# Altium schematic sheet MOSFET-Motor-Sheet-2.SchDoc
size 420 x 297 mm; SheetNumber: 8; SheetTotal: 15
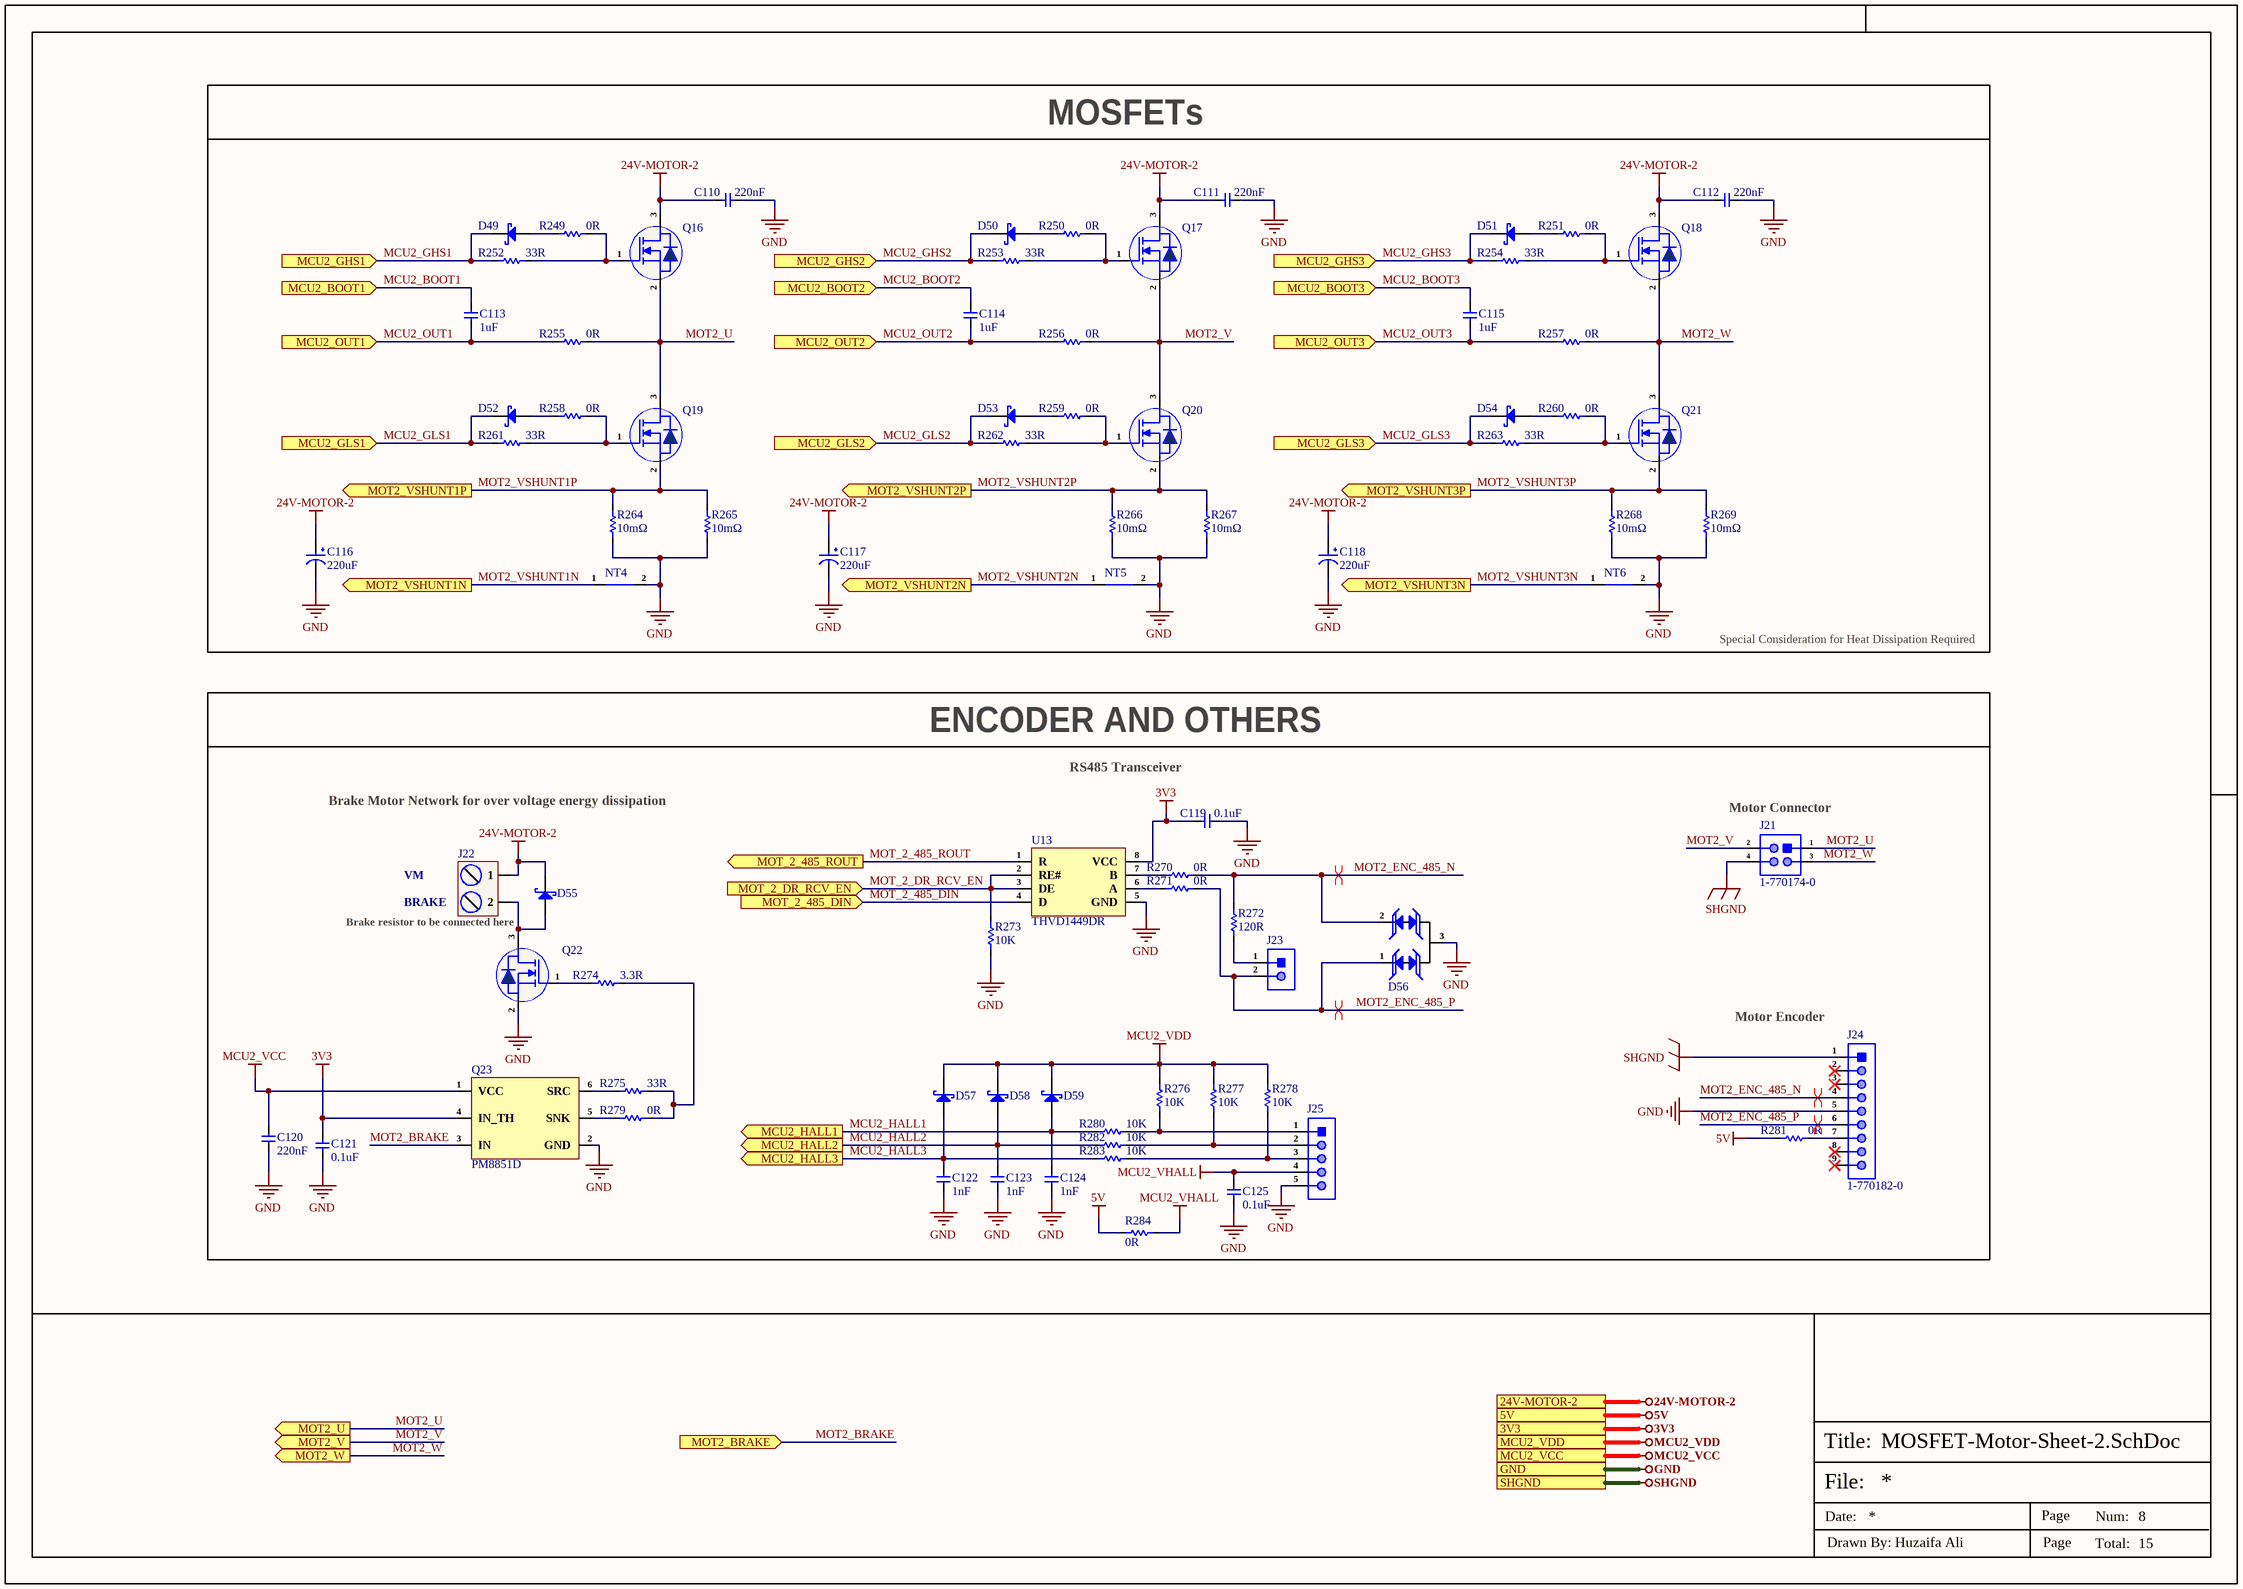
[diagram p0: MOSFET-Motor-Sheet-2.SchDoc]

## Parts
C110  220nF  [Cap-0805]
C111  220nF  [Cap-0805]
C112  220nF  [Cap-0805]
C113  1uF  [Cap-0603]
C114  1uF  [Cap-0603]
C115  1uF  [Cap-0603]
C116  220uF  [SPE1VM221E12OL]
C117  220uF  [SPE1VM221E12OL]
C118  220uF  [SPE1VM221E12OL]
C119  0.1uF  [Cap-0402]
C120  220nF  [Cap-0402]
C121  0.1uF  [Cap-0402]
C122  1nF  [Cap-0402]
C123  1nF  [Cap-0402]
C124  1nF  [Cap-0402]
C125  0.1uF  [Cap-0402]
D49  BAT48JFILM  [SOD-323]  (value not drawn)
D50  BAT48JFILM  [SOD-323]  (value not drawn)
D51  BAT48JFILM  [SOD-323]  (value not drawn)
D52  BAT48JFILM  [SOD-323]  (value not drawn)
D53  BAT48JFILM  [SOD-323]  (value not drawn)
D54  BAT48JFILM  [SOD-323]  (value not drawn)
D55  STPS3H100UF  [SMB_]  (value not drawn)
D56  SM712  [SOT-23]  (value not drawn)
D57  BAT30KFILM  [SOD-523]  (value not drawn)
D58  BAT30KFILM  [SOD-523]  (value not drawn)
D59  BAT30KFILM  [SOD-523]  (value not drawn)
J21  1-770174-0  [1-770174-0]
J22  DB128L-5.08-2P-BK-S  [DB128L-5.08-2P-BK-S]  (value not drawn)
J23  X6511WV-02H-C60D30  [HDR1X2_]  (value not drawn)
J24  1-770182-0  [1-770182-0]
J25  X6511WV-05H-C60D30  [HDR1X5_]  (value not drawn)
NT4  Net Tie_SMD  [Net Tie Pad]  (value not drawn)  (net tie, no BOM)
NT5  Net Tie_SMD  [Net Tie Pad]  (value not drawn)  (net tie, no BOM)
NT6  Net Tie_SMD  [Net Tie Pad]  (value not drawn)  (net tie, no BOM)
Q16  STH240N10F7-2  [H2PAK-2]  (value not drawn)
Q17  STH240N10F7-2  [H2PAK-2]  (value not drawn)
Q18  STH240N10F7-2  [H2PAK-2]  (value not drawn)
Q19  STH240N10F7-2  [H2PAK-2]  (value not drawn)
Q20  STH240N10F7-2  [H2PAK-2]  (value not drawn)
Q21  STH240N10F7-2  [H2PAK-2]  (value not drawn)
Q22  STH240N10F7-2  [H2PAK-2]  (value not drawn)
Q23  PM8851D  [SOT-23-6]
R249  0R  [Res-0805]
R250  0R  [Res-0805]
R251  0R  [Res-0805]
R252  33R  [Res-0402]
R253  33R  [Res-0402]
R254  33R  [Res-0402]
R255  0R  [Res-0805]
R256  0R  [Res-0805]
R257  0R  [Res-0805]
R258  0R  [Res-0805]
R259  0R  [Res-0805]
R260  0R  [Res-0805]
R261  33R  [Res-0402]
R262  33R  [Res-0402]
R263  33R  [Res-0402]
R264  10mΩ  [RES-2512]
R265  10mΩ  [RES-2512]
R266  10mΩ  [RES-2512]
R267  10mΩ  [RES-2512]
R268  10mΩ  [RES-2512]
R269  10mΩ  [RES-2512]
R270  0R  [Res-0402]
R271  0R  [Res-0402]
R272  120R  [Res-0603]
R273  10K  [Res-0402]
R274  3.3R  [Res-0402]
R275  33R  [Res-0402]
R276  10K  [Res-0402]
R277  10K  [Res-0402]
R278  10K  [Res-0402]
R279  0R  [Res-0805]
R280  10K  [Res-0402]
R281  0R  [Res-0402]
R282  10K  [Res-0402]
R283  10K  [Res-0402]
R284  0R  [Res-0805]
U13  THVD1449DR  [SOIC-8(0.154", 3.90mm Width)]

## Blocks framed on the sheet
MOSFETs: C110-C118 D49-D54 NT4-NT6 Q16-Q21 R249-R269
ENCODER AND OTHERS: C119-C125 D55-D59 J21-J25 Q22 Q23 R270-R284 U13

## Ports
3V3, 5V, 24V-MOTOR-2, GND, MCU2_BOOT1 (in), MCU2_BOOT2 (in), MCU2_BOOT3 (in), MCU2_GHS1 (in), MCU2_GHS2 (in), MCU2_GHS3 (in), MCU2_GLS1 (in), MCU2_GLS2 (in), MCU2_GLS3 (in), MCU2_HALL1 (out), MCU2_HALL2 (out), MCU2_HALL3 (out), MCU2_OUT1 (in), MCU2_OUT2 (in), MCU2_OUT3 (in), MCU2_VCC, MCU2_VDD, MOT2_BRAKE (in), MOT2_U (out), MOT2_V (out), MOT2_VSHUNT1N (out), MOT2_VSHUNT1P (out), MOT2_VSHUNT2N (out), MOT2_VSHUNT2P (out), MOT2_VSHUNT3N (out), MOT2_VSHUNT3P (out), MOT2_W (out), MOT_2_485_DIN (in), MOT_2_485_ROUT (out), MOT_2_DR_RCV_EN (in), SHGND

## Nets
3V3: C119.2 C121.2 Q23.4(IN_TH) U13.8(VCC) ; port 3V3
5V: R281.1 R284.1 ; port 5V
24V-MOTOR-2: C110.2 C111.2 C112.2 C116.1 C117.1 C118.1 D55.2(K) J22.1 Q16.3(D) Q17.3(D) Q18.3(D) ; port 24V-MOTOR-2
GND: C110.1 C111.1 C112.1 C116.2 C117.2 C118.2 C119.1 C120.1 C121.1 C122.1 C123.1 C124.1 C125.2 D56.3(GND) J24.5 J25.5 NT4.2 NT5.2 NT6.2 Q22.2(S) Q23.2(GND) R264.1 R265.1 R266.1 R267.1 R268.1 R269.1 R273.2 U13.5(GND) ; port GND
MCU2_VCC: C120.2 Q23.1(VCC) ; port MCU2_VCC
MCU2_VDD: D57.2(K) D58.2(K) D59.2(K) R276.2 R277.2 R278.2 ; port MCU2_VDD
MCU2_VHALL: C125.1 J25.4 R284.2
SHGND: J21.4 J24.1 ; port SHGND
MCU2_BOOT1: C113.2 ; port MCU2_BOOT1
MCU2_BOOT2: C114.2 ; port MCU2_BOOT2
MCU2_BOOT3: C115.2 ; port MCU2_BOOT3
MCU2_GHS1: D49.1(K) R252.1 ; port MCU2_GHS1
MCU2_GHS2: D50.1(K) R253.1 ; port MCU2_GHS2
MCU2_GHS3: D51.1(K) R254.1 ; port MCU2_GHS3
MCU2_GLS1: D52.1(K) R261.1 ; port MCU2_GLS1
MCU2_GLS2: D53.1(K) R262.1 ; port MCU2_GLS2
MCU2_GLS3: D54.1(K) R263.1 ; port MCU2_GLS3
MCU2_HALL1: C124.2 D59.1(A) R280.1 ; port MCU2_HALL1
MCU2_HALL2: C123.2 D58.1(A) R282.1 ; port MCU2_HALL2
MCU2_HALL3: C122.2 D57.1(A) R283.1 ; port MCU2_HALL3
MCU2_OUT1: C113.1 R255.1 ; port MCU2_OUT1
MCU2_OUT2: C114.1 R256.1 ; port MCU2_OUT2
MCU2_OUT3: C115.1 R257.1 ; port MCU2_OUT3
MOT2_BRAKE: Q23.3(IN) ; port MOT2_BRAKE
MOT2_ENC_485_N: D56.2(I/O2) J24.4 R270.2 R272.2
MOT2_ENC_485_P: D56.1(I/O1) J23.2 J24.6 R271.2
MOT2_U: J21.1 Q16.2(S) Q19.3(D) R255.2 ; port MOT2_U
MOT2_V: J21.2 Q17.2(S) Q20.3(D) R256.2 ; port MOT2_V
MOT2_VSHUNT1N: NT4.1 ; port MOT2_VSHUNT1N
MOT2_VSHUNT1P: Q19.2(S) R264.2 R265.2 ; port MOT2_VSHUNT1P
MOT2_VSHUNT2N: NT5.1 ; port MOT2_VSHUNT2N
MOT2_VSHUNT2P: Q20.2(S) R266.2 R267.2 ; port MOT2_VSHUNT2P
MOT2_VSHUNT3N: NT6.1 ; port MOT2_VSHUNT3N
MOT2_VSHUNT3P: Q21.2(S) R268.2 R269.2 ; port MOT2_VSHUNT3P
MOT2_W: J21.3 Q18.2(S) Q21.3(D) R257.2 ; port MOT2_W
MOT_2_485_DIN: U13.4(D) ; port MOT_2_485_DIN
MOT_2_485_ROUT: U13.1(R) ; port MOT_2_485_ROUT
MOT_2_DR_RCV_EN: R273.1 U13.2(RE#) U13.3(DE) ; port MOT_2_DR_RCV_EN
NetD49_2: D49.2(A) R249.1
NetD50_2: D50.2(A) R250.1
NetD51_2: D51.2(A) R251.1
NetD52_2: D52.2(A) R258.1
NetD53_2: D53.2(A) R259.1
NetD54_2: D54.2(A) R260.1
NetD55_1: D55.1(A) J22.2 Q22.3(D)
NetJ23_1: J23.1 R272.1
NetJ24_7: J24.7 R281.2
NetJ25_1: J25.1 R276.1 R280.2
NetJ25_2: J25.2 R277.1 R282.2
NetJ25_3: J25.3 R278.1 R283.2
NetQ16_1: Q16.1(G) R249.2 R252.2
NetQ17_1: Q17.1(G) R250.2 R253.2
NetQ18_1: Q18.1(G) R251.2 R254.2
NetQ19_1: Q19.1(G) R258.2 R261.2
NetQ20_1: Q20.1(G) R259.2 R262.2
NetQ21_1: Q21.1(G) R260.2 R263.2
NetQ22_1: Q22.1(G) R274.1
NetQ23_5: Q23.5(SNK) R279.1
NetQ23_6: Q23.6(SRC) R275.1
NetR270_1: R270.1 U13.7(B)
NetR271_1: R271.1 U13.6(A)
NetR274_2: R274.2 R275.2 R279.2

Not connected (* = marked no-connect by the designer): J24 2* 3* 8* 9*

## Layout directives
differential pair: MOT2_ENC_485_N, MOT2_ENC_485_P
differential pair; differential pair class DIFF_RS485: MOT2_ENC_485_N, MOT2_ENC_485_P

## Notes on the sheet
- Special Consideration for Heat Dissipation Required
- Brake Motor Network for over voltage energy dissipation
- (near C119) RS485 Transceiver
- (near J21) Motor Connector
- VM
- BRAKE
- Brake resistor to be connected here
- (near J24) Motor Encoder
- File:
- Title:
- Date:
- Page
- Num:
- Total:
- Drawn By: Huzaifa Ali

## Library data of the parts
C110-C112 = CC0805KKX7R0BB224: CAP CER 0.22UF 100V X7R 0805; Manufacturer: Yageo; Item Type: Capacitor; Tolerance: 10%; Supplier: Future Electronics; LCSC Part Number: C513710; Manufacturer Part Number: CC0805KKX7R0BB224; RoHS: Yes; Stock: 123000; Pricing: 3000=0.0385, 9000=0.0376, 15000=0.0372, 60000=0.0361, 90000=0.0353 (USD); Mounting Technology: Surface Mount; Case/Package: 0805; Case Code (Metric): 2012; Case Code (Imperial): 0805; Weight: 0.000194oz; Min Operating Temperature: -55°C; Max Operating Temperature: 125°C; Packaging: Tape and Reel; Value: 220nF; Voltage Rating: 100V; Dielectric: X7R; Termination: SMD/SMT; Voltage Rating (DC): 100V; Package Quantity: 3000; Series: CC; Length: 2mm; Width: 1.25mm; RoHS Compliant: Yes; ComponentLink1URL: https://media.digikey.com/pdf/Data%20Sheets/Yageo%20PDFs/NPO,%20X7R%20Mid-voltage.pdf?src-supplier=Digikey; ComponentLink1Description: https://media.digikey.com/pdf/Data%20Sheets/Yageo%20PDFs/NPO,%20X7R%20Mid-voltage.pdf?src-supplier=Digikey; ComponentLink2URL: http://www.mouser.com/ds/2/447/Yageo_UPY-GP_NP0_16V-to-50V_9-358835.pdf?src-supplier=Mouser; ComponentLink2Description: http://www.mouser.com/ds/2/447/Yageo_UPY-GP_NP0_16V-to-50V_9-358835.pdf?src-supplier=Mouser; ComponentLink3URL: https://datasheet.octopart.com/CC0805KKX7R0BB224-Yageo-datasheet-137700083.pdf?src-supplier=Future+Electronics; ComponentLink3Description: https://datasheet.octopart.com/CC0805KKX7R0BB224-Yageo-datasheet-137700083.pdf?src-supplier=Future+Electronics; ComponentLink4URL: http://www.yageo.com/documents/recent/UPY-NP0X7R_MV_100-to-630V_21.pdf?src-supplier=Digikey; ComponentLink4Description: http://www.yageo.com/documents/recent/UPY-NP0X7R_MV_100-to-630V_21.pdf?src-supplier=Digikey; ComponentLink5URL: https://datasheet.octopart.com/CC0805KKX7R0BB224-Yageo-datasheet-166511530.pdf?src-supplier=Future+Electronics; ComponentLink5Description: https://datasheet.octopart.com/CC0805KKX7R0BB224-Yageo-datasheet-166511530.pdf?src-supplier=Future+Electronics; ComponentLink6URL: https://datasheet.octopart.com/CC0805KKX7R0BB224-Yageo-datasheet-101324229.pdf?src-supplier=Newark; ComponentLink6Description: https://datasheet.octopart.com/CC0805KKX7R0BB224-Yageo-datasheet-101324229.pdf?src-supplier=Newark
C113-C115 = CL10A105KB8NNNC: CAP CER 1UF 50V X5R 0603; Manufacturer: Samsung; Material: 4241ConductorMaterial; Tolerance: 10%; Item Type: Capacitor; Supplier: Avnet; Supplier Part Number: CL10A105KB8NNNC; Manufacturer Part Number: CL10A105KB8NNNC; RoHS: Yes; Category: Ceramic Capacitors; Stock: 780446; Pricing: 4000=0.01632, 8000=0.01595, 16000=0.01557, 24000=0.0152, 32000=0.01482 (USD); Mounting Technology: Surface Mount; Case/Package: 0603; Case Code (Metric): 1608; Case Code (Imperial): 0603; Min Operating Temperature: -55°C; Max Operating Temperature: 85°C; Packaging: Tape and Reel; Value: 1uF; Voltage Rating: 50V; Dielectric: X5R; Series: CL; Voltage Rating (DC): 50V; Length: 1.6mm; Depth: 0.8mm; Radiation Hardening: No; RoHS Compliant: Yes; ComponentLink1URL: https://datasheet.ciiva.com/26877/getdatasheetpartid-753736-26877879.pdf?src-supplier=Verical; ComponentLink1Description: https://datasheet.ciiva.com/26877/getdatasheetpartid-753736-26877879.pdf?src-supplier=Verical; LCSC Part Number: C15849
C116-C118 = SPE1VM221E12OL: 35V 220uF ±20% Plugin,D6.3xL12mm Polymer Aluminum Capacitors ROHS; Manufacturer: Yunxing; Manufacturer Part Number: SPE1VM221E12OL; Package: Plugin,D6.3xL12mm; LCSC Part Number: C698133; Item Type: Capacitor; ComponentLink1Description: LCSC; ComponentLink1URL: https://www.lcsc.com/product-detail/Polymer-Aluminum-Capacitors_Yunxing-SPE1VM221E12OL_C698133.html?s_z=n_SPE1VM221E12OL
C119 C121 C125 = CC0402JRX7R7BB104: CAP CER 0.1UF 16V X7R 0402; Manufacturer: Yageo; Material: 4241ConductorMaterial; Value: 100nF; Tolerance: 5%; Item Type: Capacitor; Supplier: Digikey; Supplier Part Number: 311-1676-1-ND; Manufacturer Part Number: CC0402JRX7R7BB104; RoHS: Yes; Category: Ceramic Capacitors; Stock: 1659111; Pricing: 1=0.1, 10=0.046, 50=0.0262, 100=0.0203, 500=0.01528, 1000=0.012, 2500=0.01091, 5000=0.01004 (USD); Mounting Technology: Surface Mount; Case/Package: 0402; Case Code (Metric): 1005; Case Code (Imperial): 0402; Min Operating Temperature: -55°C; Max Operating Temperature: 125°C; Dielectric: X7R; Packaging: Tape and Reel; Package Quantity: 10000; Voltage Rating (DC): 16V; Voltage Rating: 16V; Series: CC; Construction: Flat; Length: 0.039inch; Width: 0.02inch; Height: 0.5mm; Thickness: 0.022inch; Lead Free: Lead Free; Halogen Free: Halogen Free; RoHS Compliant: Yes; ComponentLink1URL: https://datasheet.ciiva.com/13210/upy-gphc-x7r-6-3v-to-50v-8-12304-13210152.pdf?src-supplier=Mouser; ComponentLink1Description: https://datasheet.ciiva.com/13210/upy-gphc-x7r-6-3v-to-50v-8-12304-13210152.pdf?src-supplier=Mouser; LCSC Part Number: C541464
C120 = CC0402KRX5R8BB224: CAP CER 0.22UF 25V X5R 0402; Manufacturer: Yageo; Item Type: Capacitors; Tolerance: 10%; Supplier 1: Mouser; Manufacturer Part Number: CC0402KRX5R8BB224; RoHS: Yes; Stock 1: 61266; Pricing 1: 1=0.10000, 10=0.03300, 50=0.03300, 100=0.02700, 1000=0.01500, 10000=0.01300 (USD); Mount: Surface Mount; Case/Package: 0402; Min Operating Temperature: -55°C; Max Operating Temperature: 85°C; Packaging: Tape and Reel; Capacitance: 220nF; Voltage Rating: 25V; Voltage Rating (DC): 25V; Dielectric: X5R; Length: 0.039inch; Width: 0.02inch; Thickness: 0.022inch; Lead Free: Lead Free; Halogen Free: Halogen Free; RoHS Compliant: Yes; ComponentLink1URL: http://www.yageo.com/documents/recent/UPY-GPHC_X5R_4V-to-50V_25.pdf?src-supplier=Digi-Key; ComponentLink1Description: http://www.yageo.com/documents/recent/UPY-GPHC_X5R_4V-to-50V_25.pdf?src-supplier=Digi-Key; ComponentLink2URL: https://www.yageo.com/upload/media/product/productsearch/datasheet/mlcc/UPY-GPHC_X5R_4V-to-50V_26.pdf?src-supplier=Digi-Key; ComponentLink2Description: https://www.yageo.com/upload/media/product/productsearch/datasheet/mlcc/UPY-GPHC_X5R_4V-to-50V_26.pdf?src-supplier=Digi-Key; ComponentLink3URL: http://www.yageo.com/documents/recent/UPY-GPHC_X5R_4V-to-50V_23.pdf?src-supplier=Digi-Key; ComponentLink3Description: http://www.yageo.com/documents/recent/UPY-GPHC_X5R_4V-to-50V_23.pdf?src-supplier=Digi-Key; Supplier Part Number 1: 603-CC402KRX5R8BB224; LCSC Part Number: C326836
C122-C124 = CC0402KRX7R8BB102: CAP CER 1000PF 25V X7R 0402; Manufacturer: Yageo; Tolerance: 10%; Dissipation Factor: 2.5%; Insulation Resistance: 10GR; Item Type: Capacitor; Supplier 1: Arrow Electronics; Manufacturer Part Number: CC0402KRX7R8BB102; RoHS: Yes; Category: Ceramic Capacitors; Stock 1: 370000; Pricing 1: 1=0.00230, 10000=0.00230, 100001=0.00190 (USD); Mount: Surface Mount; Case/Package: 0402; Number of Pins: 2; Case Code (Imperial): 0402; Case Code (Metric): 1005; Min Operating Temperature: -55°C; Max Operating Temperature: 125°C; Capacitance: 1nF; Packaging: Tape and Reel; Voltage Rating: 25V; Dielectric: X7R; Termination: SMD/SMT; Voltage Rating (DC): 25V; Series: CC; Length: 1mm; Width: 0.02inch; Thickness: 0.022inch; Depth: 0.5mm; Radiation Hardening: No; Lead Free: Lead Free; Halogen Free: Halogen Free; RoHS Compliant: Yes; ComponentLink1URL: https://datasheet.ciiva.com/26862/getdatasheetpartid-639817-26862638.pdf?src-supplier=Verical; ComponentLink1Description: https://datasheet.ciiva.com/26862/getdatasheetpartid-639817-26862638.pdf?src-supplier=Verical; ComponentLink2URL: https://datasheet.ciiva.com/5425/upy-gp-np0-16v-to-50v-8-3714-5425527.pdf?src-supplier=Mouser; ComponentLink2Description: https://datasheet.ciiva.com/5425/upy-gp-np0-16v-to-50v-8-3714-5425527.pdf?src-supplier=Mouser; Supplier Part Number 1: CC0402KRX7R8BB102; LCSC Part Number: C541372
D49-D54 = BAT48JFILM: DIODE SCHOTTKY 40V 350MA SOD323; Manufacturer: STMicroelectronics; Supplier: Future Electronics; LCSC Part Number: C2798199; Manufacturer Part Number: BAT48JFILM; RoHS: Yes; Item Type: Diode; Stock: 21000; Pricing: 3000=0.0329, 9000=0.0316, 15000=0.031, 30000=0.0303, 60000=0.0291 (USD); ComponentLink1URL: https://datasheet.ciiva.com/23920/1449576-23920129.pdf?src-supplier=Newark; ComponentLink1Description: https://datasheet.ciiva.com/23920/1449576-23920129.pdf?src-supplier=Newark; ComponentLink2URL: https://datasheet.ciiva.com/4714/cd00130229-113731-4714649.pdf?src-supplier=Mouser; ComponentLink2Description: https://datasheet.ciiva.com/4714/cd00130229-113731-4714649.pdf?src-supplier=Mouser; ComponentLink3URL: https://datasheet.ciiva.com/915/cd00130229-915689.pdf?src-supplier=Digikey; ComponentLink3Description: https://datasheet.ciiva.com/915/cd00130229-915689.pdf?src-supplier=Digikey; ComponentLink4URL: https://datasheet.ciiva.com/915/cd00130229-915690.pdf?src-supplier=Digikey; ComponentLink4Description: https://datasheet.ciiva.com/915/cd00130229-915690.pdf?src-supplier=Digikey; ComponentLink5URL: https://datasheet.ciiva.com/915/cd00130229-915691.pdf?src-supplier=Digikey; ComponentLink5Description: https://datasheet.ciiva.com/915/cd00130229-915691.pdf?src-supplier=Digikey; ComponentLink6URL: https://datasheet.ciiva.com/16206/cd00130229-16206668.pdf?src-supplier=Future+Electronics; ComponentLink6Description: https://datasheet.ciiva.com/16206/cd00130229-16206668.pdf?src-supplier=Future+Electronics
D55 = STPS3H100UF: DIODE SCHOTTKY 100V 3A SMBFLAT; Manufacturer: STMicroelectronics; Supplier: Mouser; LCSC Part Number: C155643; Manufacturer Part Number: STPS3H100UF; RoHS: Yes; Item Type: Diode; Stock: 122842; Pricing: 1=0.35, 10=0.257, 50=0.257, 100=0.213, 1000=0.143, 10000=0.103 (USD); Lead Free: 5697LeadFree; RoHS Compliant: 5897YesNo; ComponentLink1URL: https://datasheet.ciiva.com/4716/cd00256107-65241-4716262.pdf?src-supplier=Mouser; ComponentLink1Description: https://datasheet.ciiva.com/4716/cd00256107-65241-4716262.pdf?src-supplier=Mouser; ComponentLink2URL: https://datasheet.ciiva.com/915/cd00256107-915837.pdf?src-supplier=Digikey; ComponentLink2Description: https://datasheet.ciiva.com/915/cd00256107-915837.pdf?src-supplier=Digikey; ComponentLink3URL: https://datasheet.ciiva.com/915/cd00256107-915838.pdf?src-supplier=Digikey; ComponentLink3Description: https://datasheet.ciiva.com/915/cd00256107-915838.pdf?src-supplier=Digikey; ComponentLink4URL: https://datasheet.ciiva.com/915/cd00256107-915839.pdf?src-supplier=Digikey; ComponentLink4Description: https://datasheet.ciiva.com/915/cd00256107-915839.pdf?src-supplier=Digikey; ComponentLink5URL: https://datasheet.ciiva.com/16491/cd00256107-16491518.pdf?src-supplier=Future+Electronics; ComponentLink5Description: https://datasheet.ciiva.com/16491/cd00256107-16491518.pdf?src-supplier=Future+Electronics
D56 = SM712: SOT-23 TVS ROHS; Manufacturer: TECH PUBLIC; Item Type: Diode; Manufacturer Part Number: SM712; Package: SOT-23; LCSC Part Number: C521963; ComponentLink1Description: LCSC; ComponentLink1URL: https://www.lcsc.com/product-detail/TVS_TECH-PUBLIC-SM712_C521963.html
D57-D59 = BAT30KFILM: DIODE SCHOTTKY 30V 300MA SOD523; Manufacturer: STMicroelectronics; Supplier: Digikey; LCSC Part Number: C2926449; Manufacturer Part Number: BAT30KFILM; RoHS: Yes; Item Type: Diode; Stock: 129643; Pricing: 1=0.33, 10=0.204, 100=0.1279, 500=0.09468, 1000=0.08393 (USD); ComponentLink1URL: https://datasheet.ciiva.com/15192/getdatasheetpartid-146449-15192970.pdf?src-supplier=Verical; ComponentLink1Description: https://datasheet.ciiva.com/15192/getdatasheetpartid-146449-15192970.pdf?src-supplier=Verical; ComponentLink2URL: https://datasheet.ciiva.com/16418/cd00126118-16418392.pdf?src-supplier=Future+Electronics; ComponentLink2Description: https://datasheet.ciiva.com/16418/cd00126118-16418392.pdf?src-supplier=Future+Electronics; ComponentLink3URL: https://datasheet.ciiva.com/915/cd00126118-915601.pdf?src-supplier=Digikey; ComponentLink3Description: https://datasheet.ciiva.com/915/cd00126118-915601.pdf?src-supplier=Digikey; ComponentLink4URL: https://datasheet.ciiva.com/915/cd00126118-915602.pdf?src-supplier=Digikey; ComponentLink4Description: https://datasheet.ciiva.com/915/cd00126118-915602.pdf?src-supplier=Digikey; ComponentLink5URL: https://datasheet.ciiva.com/915/cd00126118-915603.pdf?src-supplier=Digikey; ComponentLink5Description: https://datasheet.ciiva.com/915/cd00126118-915603.pdf?src-supplier=Digikey
J21 = 1-770174-0: CONN HEADER VERT 4POS 4.14MM; Manufacturer: TE Connectivity; Item Type: Power Connectors; Supplier: Future Electronics; Supplier Part Number: 3310547; Manufacturer Part Number: 1-770174-0; RoHS: Yes; Stock: 890; Pricing: 1=0.995, 30=1.04, 40=0.945, 125=0.91, 300=0.95, 400=0.87, 1250=0.8 (USD); ComponentLink1URL: https://datasheet.ciiva.com/19460/746478-19460823.pdf?src-supplier=Jameco; ComponentLink1Description: https://datasheet.ciiva.com/19460/746478-19460823.pdf?src-supplier=Jameco; ComponentLink2URL: https://datasheet.ciiva.com/11755/0900766b80b8608c-11755178.pdf?src-supplier=Rs; ComponentLink2Description: https://datasheet.ciiva.com/11755/0900766b80b8608c-11755178.pdf?src-supplier=Rs; ComponentLink3URL: https://datasheet.ciiva.com/16324/eng-cs-82181-softshell-high-density-0508-16324224.pdf?src-supplier=Future+Electronics; ComponentLink3Description: https://datasheet.ciiva.com/16324/eng-cs-82181-softshell-high-density-0508-16324224.pdf?src-supplier=Future+Electronics; ComponentLink4URL: https://datasheet.ciiva.com/1111/eng-cd-770174-l2-1111782.pdf?src-supplier=Element14; ComponentLink4Description: https://datasheet.ciiva.com/1111/eng-cd-770174-l2-1111782.pdf?src-supplier=Element14; ComponentLink5URL: https://datasheet.ciiva.com/15173/getdatasheetpartid-47574-15173655.pdf?src-supplier=Verical; ComponentLink5Description: https://datasheet.ciiva.com/15173/getdatasheetpartid-47574-15173655.pdf?src-supplier=Verical; ComponentLink6URL: https://datasheet.ciiva.com/710/eng-cd-770174-m-710026.pdf?src-supplier=Digikey; ComponentLink6Description: https://datasheet.ciiva.com/710/eng-cd-770174-m-710026.pdf?src-supplier=Digikey; ComponentLink7URL: https://datasheet.ciiva.com/3126/eng-cs-82181-softshell-high-density-0408-3126092.pdf?src-supplier=Avnet; ComponentLink7Description: https://datasheet.ciiva.com/3126/eng-cs-82181-softshell-high-density-0408-3126092.pdf?src-supplier=Avnet; ComponentLink8URL: https://datasheet.ciiva.com/30189/eng-cs-82181-softshell-high-density-0508-30189644.pdf?src-supplier=Onlinecomponents.com; ComponentLink8Description: https://datasheet.ciiva.com/30189/eng-cs-82181-softshell-high-density-0508-30189644.pdf?src-supplier=Onlinecomponents.com; ComponentLink9URL: https://datasheet.ciiva.com/29266/745091-da-01-en-4-pol-mini-univ-mate-n-lok-stecksockel-29266107.pdf?src-supplier=Conrad; ComponentLink9Description: https://datasheet.ciiva.com/29266/745091-da-01-en-4-pol-mini-univ-mate-n-lok-stecksockel-29266107.pdf?src-supplier=Conrad
J22 = DB128L-5.08-2P-BK-S: 1x2P 18A -40℃~+105℃ 250V Black 12~30 Straight pin 5.08mm 2.5 1 2 Plugin,P=5.08mm Screw terminal ROHS; Manufacturer: DIBO; Item Type: Terminal Block; Manufacturer Part Number: DB128L-5.08-2P-BK-S; Package: Plugin,P=5.08mm; LCSC Part Number: C430601; ComponentLink1Description: LCSC; ComponentLink1URL: https://www.lcsc.com/product-detail/Screw-terminal_span-style-background-color-ff0-DIBO-span-DB128L-5-08-2P-BK-S_C430601.html
J23 = X6511WV-02H-C60D30: Gold 250V 3A Straight Square Pins 2.5mm 2P 260℃ 6mm -40℃~+105℃ 3mm 2.54mm Plugin Black Brass 1x2P Plugin,P=2.54mm Pin Headers ROHS; Manufacturer: XKB; Item Type: Male Header; Manufacturer Part Number: X6511WV-02H-C60D30; Package: Plugin,P=2.54mm; LCSC Part Number: C706874; ComponentLink1Description: LCSC; ComponentLink1URL: https://www.lcsc.com/product-detail/Pin-Headers_XKB-Connectivity-X6511WV-02H-C60D30_C706874.html
J24 = 1-770182-0: CONN HEADER VERT 9POS 4.14MM; Manufacturer: TE Connectivity; Item Type: Power Connectors; Supplier: Future Electronics; LCSC Part Number: C3151769; Manufacturer Part Number: 1-770182-0; RoHS: Yes; Stock: 4602; Pricing: 1=1.17, 30=1.14, 125=1.1, 300=1.08, 1250=1.03 (USD); ComponentLink1URL: https://datasheet.ciiva.com/714/eng-cd-770182-l1-714801.pdf?src-supplier=Farnell; ComponentLink1Description: https://datasheet.ciiva.com/714/eng-cd-770182-l1-714801.pdf?src-supplier=Farnell; ComponentLink2URL: https://datasheet.ciiva.com/11755/0900766b80b8608c-11755213.pdf?src-supplier=Rs; ComponentLink2Description: https://datasheet.ciiva.com/11755/0900766b80b8608c-11755213.pdf?src-supplier=Rs; ComponentLink3URL: https://datasheet.ciiva.com/16222/eng-cs-82181-softshell-high-density-0508-16222388.pdf?src-supplier=Future+Electronics; ComponentLink3Description: https://datasheet.ciiva.com/16222/eng-cs-82181-softshell-high-density-0508-16222388.pdf?src-supplier=Future+Electronics; ComponentLink4URL: https://datasheet.ciiva.com/19460/892141-19460018.pdf?src-supplier=Jameco; ComponentLink4Description: https://datasheet.ciiva.com/19460/892141-19460018.pdf?src-supplier=Jameco; ComponentLink5URL: https://datasheet.ciiva.com/41446/001231547-da-01-en-stiftsockel-180grad-1-0770182-0-41446360.pdf?src-supplier=Conrad; ComponentLink5Description: https://datasheet.ciiva.com/41446/001231547-da-01-en-stiftsockel-180grad-1-0770182-0-41446360.pdf?src-supplier=Conrad; ComponentLink6URL: https://datasheet.ciiva.com/14154/770182-eng-datasheet-14154870.pdf?src-supplier=Distrelec; ComponentLink6Description: https://datasheet.ciiva.com/14154/770182-eng-datasheet-14154870.pdf?src-supplier=Distrelec; ComponentLink7URL: https://datasheet.ciiva.com/1111/1648474-1111785.pdf?src-supplier=Element14; ComponentLink7Description: https://datasheet.ciiva.com/1111/1648474-1111785.pdf?src-supplier=Element14; ComponentLink8URL: https://datasheet.ciiva.com/15173/getdatasheetpartid-92655-15173754.pdf?src-supplier=Verical; ComponentLink8Description: https://datasheet.ciiva.com/15173/getdatasheetpartid-92655-15173754.pdf?src-supplier=Verical; ComponentLink9URL: https://datasheet.ciiva.com/3126/eng-cs-82181-softshell-high-density-0408-3126095.pdf?src-supplier=Avnet; ComponentLink9Description: https://datasheet.ciiva.com/3126/eng-cs-82181-softshell-high-density-0408-3126095.pdf?src-supplier=Avnet; ComponentLink10URL: https://datasheet.ciiva.com/30155/eng-cs-82181-softshell-high-density-0508-30155467.pdf?src-supplier=Onlinecomponents.com; ComponentLink10Description: https://datasheet.ciiva.com/30155/eng-cs-82181-softshell-high-density-0508-30155467.pdf?src-supplier=Onlinecomponents.com
J25 = X6511WV-05H-C60D30: Gold 250V 3A Straight Square Pins 2.5mm 5P 260℃ 6mm -40℃~+105℃ 3mm 2.54mm Plugin Black Brass 1x5P Plugin,P=2.54mm Pin Headers ROHS; Manufacturer: XKB; Item Type: Male Header; ComponentLink1Description: LCSC; ComponentLink1URL: https://www.lcsc.com/product-detail/Pin-Headers_XKB-Connectivity-X6511WV-05H-C60D30_C706877.html; Manufacturer Part Number: X6511WV-05H-C60D30; Package: Plugin,P=2.54mm; LCSC Part Number: C706877
NT4-NT6 = Net Tie_SMD: Net Tie SMD; Manufacturer Part Number: Net Tie; Item Type: Net Tie Pad
Q16-Q22 = STH240N10F7-2: MOSFET N-CH 100V 180A H2PAK-2; Manufacturer: STMicroelectronics; Item Type: MOSFETs; Supplier: Mouser; LCSC Part Number: C3278109; Manufacturer Part Number: STH240N10F7-2; RoHS: Yes; Stock: 947; Pricing: 1=5.25, 10=5.25, 50=5.25, 100=5.25, 1000=1.89, 10000=1.89 (USD); ComponentLink1URL: http://www.mouser.com/ds/2/389/sth240n10f7-2-956094.pdf?src-supplier=Mouser; ComponentLink1Description: http://www.mouser.com/ds/2/389/sth240n10f7-2-956094.pdf?src-supplier=Mouser; ComponentLink2URL: http://www.st.com/content/ccc/resource/technical/document/datasheet/c0/bb/6e/12/19/24/43/41/DM00111318.pdf/files/DM00111318.pdf/jcr:content/translations/en.DM00111318.pdf?src-supplier=Digikey; ComponentLink2Description: http://www.st.com/content/ccc/resource/technical/document/datasheet/c0/bb/6e/12/19/24/43/41/DM00111318.pdf/files/DM00111318.pdf/jcr:content/translations/en.DM00111318.pdf?src-supplier=Digikey
Q23 = PM8851D: IC GATE DRVR LOW-SIDE SOT23-6; Manufacturer: STMicroelectronics; Supplier: Mouser; LCSC Part Number: C2971234; Manufacturer Part Number: PM8851D; RoHS: Yes; Stock: 15305; Pricing: 1=0.83, 10=0.537, 50=0.537, 100=0.44, 1000=0.405, 10000=0.341 (USD); ComponentLink1URL: http://www.st.com/content/ccc/resource/technical/document/datasheet/group3/2f/81/d0/59/c5/1d/48/68/DM00140981/files/DM00140981.pdf/jcr:content/translations/en.DM00140981.pdf?src-supplier=Digikey; ComponentLink1Description: http://www.st.com/content/ccc/resource/technical/document/datasheet/group3/2f/81/d0/59/c5/1d/48/68/DM00140981/files/DM00140981.pdf/jcr:content/translations/en.DM00140981.pdf?src-supplier=Digikey; ComponentLink2URL: http://www.st.com/st-web-ui/static/active/en/resource/technical/document/datasheet/DM00140981.pdf?src-supplier=Avnet; ComponentLink2Description: http://www.st.com/st-web-ui/static/active/en/resource/technical/document/datasheet/DM00140981.pdf?src-supplier=Avnet
R249-R251 R255-R260 R279 R284 = RC0805FR-070RL: RES 0 OHM JUMPER 1/8W 0805; Manufacturer: Yageo; Resistance: 0mR; Tolerance: 1%; Power Rating: 125mW; Item Type: Resistor; Supplier 1: Avnet; Manufacturer Part Number: RC0805FR-070RL; RoHS: Yes; Category: Chip SMD Resistors; Stock 1: 85000; Pricing 1: 5000=0.00281, 10000=0.00277, 20000=0.00269 (USD); Case/Package: 0805; Contact Plating: Tin,Matte; Case Code (Imperial): 0805; Case Code (Metric): 2012; Size Code: 0805; Min Operating Temperature: -55°C; Max Operating Temperature: 155°C; Resistor Type: Thick Film; Packaging: Tape and Reel; Features: Moisture Resistant; Series: RC; Max Power Dissipation: 125mW; Number of Terminations: 2; Construction: Rectangular; Length: 2mm; Depth: 1.25mm; Radiation Hardening: No; Military Standard: Not; Lead Free: Lead Free; RoHS Compliant: Yes; ComponentLink1URL: https://datasheet.ciiva.com/15189/getdatasheetpartid-348154-15189885.pdf?src-supplier=Verical; ComponentLink1Description: https://datasheet.ciiva.com/15189/getdatasheetpartid-348154-15189885.pdf?src-supplier=Verical; ComponentLink2URL: https://datasheet.ciiva.com/17042/rc0805-17042698.pdf?src-supplier=Future+Electronics; ComponentLink2Description: https://datasheet.ciiva.com/17042/rc0805-17042698.pdf?src-supplier=Future+Electronics; Supplier Part Number 1: RC0805FR-070RL; LCSC Part Number: C100045
R252-R254 R261-R263 R275 = RC0402FR-0733RL: RES 33 OHM 1% 1/16W 0402; Manufacturer: Yageo; Power Rating: 62.5mW; Voltage Rating: 50V; Temperature Coefficient: 100ppm/°C; Max Power Dissipation: 63mW; Supplier 1: Mouser; Manufacturer Part Number: RC0402FR-0733RL; RoHS: Yes; Category: Chip SMD Resistors; Stock 1: 1843488; Pricing 1: 1=0.10000, 10=0.01200, 50=0.01200, 100=0.00500, 1000=0.00300, 10000=0.00100 (USD); Case/Package: 0402; Number of Pins: 2; Case Code (Imperial): 0402; Case Code (Metric): 1005; Size Code: 0402; Min Operating Temperature: -55°C; Max Operating Temperature: 155°C; Resistor Type: Thick Film; Resistance: 33R; Tolerance: 1%; Packaging: Tape and Reel; Voltage Rating (DC): 50V; Package Quantity: 10000; Termination: SMD/SMT; Features: Moisture Resistant; Series: RC; Number of Terminations: 2; Resistance Tolerance: 1%; Construction: Rectangular; Technology: THICK FILM; Length: 1mm; Width: 0.5mm; Height: 0.35mm; Depth: 0.5mm; RoHS Compliant: Yes; REACH SVHC: Unknown; Military Standard: Not; Lead Free: Lead Free; ComponentLink1URL: https://datasheet.ciiva.com/11819/0900766b80c66297-11819487.pdf?src-supplier=RSComponents; ComponentLink1Description: https://datasheet.ciiva.com/11819/0900766b80c66297-11819487.pdf?src-supplier=RSComponents; ComponentLink2URL: https://datasheet.ciiva.com/24070/pyu-rc0402-51-rohs-l-6-r-8721-24070077.pdf?src-supplier=Mouser; ComponentLink2Description: https://datasheet.ciiva.com/24070/pyu-rc0402-51-rohs-l-6-r-8721-24070077.pdf?src-supplier=Mouser; ComponentLink3URL: https://datasheet.ciiva.com/7849/1018594-7849967.pdf?src-supplier=Element14; ComponentLink3Description: https://datasheet.ciiva.com/7849/1018594-7849967.pdf?src-supplier=Element14; ComponentLink4URL: https://datasheet.ciiva.com/7849/1018594-7849966.pdf?src-supplier=Element14; ComponentLink4Description: https://datasheet.ciiva.com/7849/1018594-7849966.pdf?src-supplier=Element14; ComponentLink5URL: https://datasheet.ciiva.com/15189/getdatasheetpartid-329253-15189431.pdf?src-supplier=Verical; ComponentLink5Description: https://datasheet.ciiva.com/15189/getdatasheetpartid-329253-15189431.pdf?src-supplier=Verical; ComponentLink6URL: https://datasheet.ciiva.com/17070/pyu-rc0402-51-rohs-l-6-r-17070335.pdf?src-supplier=Future+Electronics; ComponentLink6Description: https://datasheet.ciiva.com/17070/pyu-rc0402-51-rohs-l-6-r-17070335.pdf?src-supplier=Future+Electronics; Supplier Part Number 1: 603-RC0402FR-0733RL; LCSC Part Number: C138002
R264-R269 = CRA2512-FZ-R010ELF: RES 0.01 OHM 1% 3W 2512; Manufacturer: Bourns; Value: 10mR; Temperature Coefficient: 75ppm/°C; Item Type: Resistor; Supplier: Rs; Supplier Part Number: 6934381P; Manufacturer Part Number: CRA2512-FZ-R010ELF; RoHS: No; Category: Chip SMD Resistors; Stock: 15000; Pricing: 50=0.49, 100=0.46, 250=0.428, 500=0.39 (GBP); Case/Package: 348Case; Pins: 2NUMBER; Case Code (Imperial): 2512; Case Code (Metric): 6432; Min Operating Temperature: -55°C; Max Operating Temperature: 170°C; Resistor Type: Metal Film; Power Rating: 3W; Resistance Tolerance: 1%; Packaging: 13Packaging; Tolerance: 1%; Width: 3.2mm; Height: 900um; ComponentLink1URL: http://www.farnell.com/datasheets/2253366.pdf?src-supplier=Farnell; ComponentLink1Description: http://www.farnell.com/datasheets/2253366.pdf?src-supplier=Farnell; ComponentLink2URL: https://www.bourns.com/docs/product-datasheets/cra.pdf?src-supplier=Digikey; ComponentLink2Description: https://www.bourns.com/docs/product-datasheets/cra.pdf?src-supplier=Digikey; ComponentLink3URL: https://datasheet.octopart.com/CRA2512-FZ-R010ELF-Bourns-datasheet-15983344.pdf?src-supplier=Element14; ComponentLink3Description: https://datasheet.octopart.com/CRA2512-FZ-R010ELF-Bourns-datasheet-15983344.pdf?src-supplier=Element14; ComponentLink4URL: http://www.farnell.com/datasheets/1849485.pdf?src-supplier=Newark; ComponentLink4Description: http://www.farnell.com/datasheets/1849485.pdf?src-supplier=Newark; ComponentLink5URL: https://datasheet.octopart.com/CRA2512-FZ-R010ELF-Bourns-datasheet-68301994.pdf?src-supplier=Newark; ComponentLink5Description: https://datasheet.octopart.com/CRA2512-FZ-R010ELF-Bourns-datasheet-68301994.pdf?src-supplier=Newark; ComponentLink6URL: http://www.farnell.com/datasheets/2253366.pdf?src-supplier=Newark; ComponentLink6Description: http://www.farnell.com/datasheets/2253366.pdf?src-supplier=Newark; LCSC Part Number: C840621
R270 R271 R281 = RC0402FR-070RL: RES 0 OHM JUMPER 1/16W 0402; Manufacturer: Yageo; Item Type: Resistors; Tolerance: 1%; Power Rating: 62.5mW; Voltage Rating: 50V; Temperature Coefficient: 200ppm/°C; Max Power Dissipation: 63mW; Supplier 1: Mouser; Manufacturer Part Number: RC0402FR-070RL; RoHS: Yes; Stock 1: 8556842; Pricing 1: 1=0.10000, 10=0.01400, 50=0.01400, 100=0.00600, 1000=0.00300, 5000=0.00200, 10000=0.00100 (USD); Mount: Surface Mount; Case/Package: 0402; Contact Plating: Tin,Matte; Case Code (Imperial): 0402; Case Code (Metric): 1005; Size Code: 0402; Min Operating Temperature: -55°C; Max Operating Temperature: 155°C; Resistance: 0R; Resistor Type: Thick Film; Packaging: Tape and Reel; Termination: SMD/SMT; Features: Moisture Resistant; Series: RC; Number of Terminations: 2; Length: 1mm; Width: 0.5mm; Height: 0.35mm; Radiation Hardening: No; Lead Free: Lead Free; RoHS Compliant: Yes; ComponentLink1URL: https://datasheet.ciiva.com/8896/pyu-rc0402-51-rohs-l-6-8896149.pdf?src-supplier=Avnet; ComponentLink1Description: https://datasheet.ciiva.com/8896/pyu-rc0402-51-rohs-l-6-8896149.pdf?src-supplier=Avnet; ComponentLink2URL: https://datasheet.ciiva.com/16790/pyu-rc0402-51-rohs-l-6-r-16790444.pdf?src-supplier=Future+Electronics; ComponentLink2Description: https://datasheet.ciiva.com/16790/pyu-rc0402-51-rohs-l-6-r-16790444.pdf?src-supplier=Future+Electronics; Supplier Part Number 1: 603-RC0402FR-070RL; LCSC Part Number: C106231
R272 = RC0603FR-07120RL: RES 120 OHM 1% 1/10W 0603; Manufacturer: Yageo; Temperature Coefficient: 100ppm/°C; Voltage Rating (DC): 50V; Power Rating: 100mW; Item Type: Resistor; Supplier 1: Digi-Key; Manufacturer Part Number: RC0603FR-07120RL; RoHS: Yes; Category: Chip SMD Resistors; Stock 1: 839061; Pricing 1: 1=0.10000, 10=0.02400, 100=0.00970, 1000=0.00436, 2500=0.00378 (USD); Case/Package: 0603; Number of Pins: 2; Case Code (Metric): 1608; Case Code (Imperial): 0603; Size Code: 0603; Min Operating Temperature: -55°C; Max Operating Temperature: 155°C; Resistance: 120R; Tolerance: 1%; Resistor Type: Thick Film; Packaging: Tape and Reel; Voltage Rating: 50V; Package Quantity: 1; Number of Terminations: 2; Termination: SMD/SMT; Max Power Dissipation: 100mW; Features: Moisture Resistant; Series: RC; Construction: Rectangular; Resistance Tolerance: 1%; Length: 1.6mm; Width: 0.031inch; Height: 0.022inch; Depth: 0.8mm; REACH SVHC: No SVHC; Lead Free: Lead Free; Military Standard: Not; RoHS Compliant: Yes; ComponentLink1URL: https://datasheet.ciiva.com/2553/pyu-r-int-thick-7-2553512.pdf?src-supplier=Digi-Key; ComponentLink1Description: https://datasheet.ciiva.com/2553/pyu-r-int-thick-7-2553512.pdf?src-supplier=Digi-Key; ComponentLink2URL: https://datasheet.ciiva.com/7746/443971-7746248.pdf?src-supplier=Element14; ComponentLink2Description: https://datasheet.ciiva.com/7746/443971-7746248.pdf?src-supplier=Element14; ComponentLink3URL: https://datasheet.ciiva.com/2553/pyu-r-int-thick-7-2553513.pdf?src-supplier=Digi-Key; ComponentLink3Description: https://datasheet.ciiva.com/2553/pyu-r-int-thick-7-2553513.pdf?src-supplier=Digi-Key; ComponentLink4URL: https://datasheet.ciiva.com/7746/443971-7746249.pdf?src-supplier=Element14; ComponentLink4Description: https://datasheet.ciiva.com/7746/443971-7746249.pdf?src-supplier=Element14; ComponentLink5URL: https://datasheet.ciiva.com/2553/pyu-r-int-thick-7-2553514.pdf?src-supplier=Digi-Key; ComponentLink5Description: https://datasheet.ciiva.com/2553/pyu-r-int-thick-7-2553514.pdf?src-supplier=Digi-Key; ComponentLink6URL: https://datasheet.ciiva.com/46395/443971-46395021.pdf?src-supplier=Element14; ComponentLink6Description: https://datasheet.ciiva.com/46395/443971-46395021.pdf?src-supplier=Element14; Supplier Part Number 1: 311-120HRCT-ND; LCSC Part Number: C114640
R273 R276-R278 R280 R282 R283 = RC0402FR-0710KL: RES 10K OHM 1% 1/16W 0402; Manufacturer: Yageo; Resistance: 10kR; Voltage Rating (DC): 50V; Temperature Coefficient: 100ppm/°C; Power Rating: 62.5mW; Max Power Dissipation: 63mW; Item Type: Resistor; Supplier 1: Mouser; Manufacturer Part Number: RC0402FR-0710KL; RoHS: Yes; Category: Chip SMD Resistors; Stock 1: 18648329; Pricing 1: 1=0.10000, 10=0.01400, 50=0.01400, 100=0.00500, 1000=0.00300, 10000=0.00200 (USD); Case/Package: 0402; Number of Pins: 2; Case Code (Imperial): 0402; Case Code (Metric): 1005; Min Operating Temperature: -55°C; Max Operating Temperature: 155°C; Resistor Type: Thick Film; Tolerance: 1%; Packaging: Tape and Reel; Voltage Rating: 50V; Termination: SMD/SMT; Working Voltage: 50V; Number of Terminations: 2; Features: Moisture Resistant; Series: RC; Resistance Tolerance: 1%; Construction: Rectangular; Length: 1mm; Width: 0.5mm; Height: 0.32mm; Depth: 0.5mm; Lead Pitch: 0.2mm; REACH SVHC: No SVHC; Lead Free: Lead Free; RoHS Compliant: Yes; Military Standard: Not; ComponentLink1URL: https://datasheet.ciiva.com/7660/38568-7660787.pdf?src-supplier=Element14; ComponentLink1Description: https://datasheet.ciiva.com/7660/38568-7660787.pdf?src-supplier=Element14; ComponentLink2URL: https://datasheet.ciiva.com/7849/1686128-7849814.pdf?src-supplier=Element14; ComponentLink2Description: https://datasheet.ciiva.com/7849/1686128-7849814.pdf?src-supplier=Element14; ComponentLink3URL: https://datasheet.ciiva.com/7983/1018594-7983486.pdf?src-supplier=Element14; ComponentLink3Description: https://datasheet.ciiva.com/7983/1018594-7983486.pdf?src-supplier=Element14; ComponentLink4URL: https://datasheet.ciiva.com/22747/1018594-22747512.pdf?src-supplier=Element14; ComponentLink4Description: https://datasheet.ciiva.com/22747/1018594-22747512.pdf?src-supplier=Element14; ComponentLink5URL: https://datasheet.ciiva.com/12667/pyu-rc0402-51-rohs-l-6-r-12667067.pdf?src-supplier=Mouser; ComponentLink5Description: https://datasheet.ciiva.com/12667/pyu-rc0402-51-rohs-l-6-r-12667067.pdf?src-supplier=Mouser; ComponentLink6URL: https://datasheet.ciiva.com/7849/1784430-7849813.pdf?src-supplier=Element14; ComponentLink6Description: https://datasheet.ciiva.com/7849/1784430-7849813.pdf?src-supplier=Element14; ComponentLink7URL: https://datasheet.ciiva.com/7849/1784430-7849815.pdf?src-supplier=Element14; ComponentLink7Description: https://datasheet.ciiva.com/7849/1784430-7849815.pdf?src-supplier=Element14; Supplier Part Number 1: 603-RC0402FR-0710KL; LCSC Part Number: C60490
R274 = RC0402FR-073R3L: RES 3.3 OHM 1% 1/16W 0402; Manufacturer: Yageo; Temperature Coefficient: 200ppm/°C; Power Rating: 63mW; Voltage Rating: 50V; Supplier 1: Mouser; Manufacturer Part Number: RC0402FR-073R3L; RoHS: Yes; Category: Chip SMD Resistors; Stock 1: 167510; Pricing 1: 1=0.10000, 10=0.02200, 50=0.02200, 100=0.00900, 1000=0.00400, 10000=0.00200 (USD); Case/Package: 0402; Contact Plating: Tin,Matte; Case Code (Imperial): 0402; Case Code (Metric): 1005; Size Code: 0402; Min Operating Temperature: -55°C; Max Operating Temperature: 155°C; Tolerance: 1%; Resistance: 3.3R; Resistor Type: Thick Film; Packaging: Tape and Reel; Termination: SMD/SMT; Voltage Rating (DC): 50V; Features: Moisture Resistant; Series: RC; Max Power Dissipation: 63mW; Number of Terminations: 2; Construction: Rectangular; Resistance Tolerance: 1%; Length: 1mm; Depth: 0.5mm; REACH SVHC: Unknown; Military Standard: Not; Lead Free: Lead Free; RoHS Compliant: Yes; ComponentLink1URL: https://datasheet.ciiva.com/7849/1018594-7849999.pdf?src-supplier=Element14; ComponentLink1Description: https://datasheet.ciiva.com/7849/1018594-7849999.pdf?src-supplier=Element14; ComponentLink2URL: https://datasheet.ciiva.com/8893/pyu-rc0402-51-rohs-l-6-8893711.pdf?src-supplier=Avnet; ComponentLink2Description: https://datasheet.ciiva.com/8893/pyu-rc0402-51-rohs-l-6-8893711.pdf?src-supplier=Avnet; Supplier Part Number 1: 603-RC0402FR-073R3L; LCSC Part Number: C137986
U13 = THVD1449DR: IC TRANSCEIVER HALF 1/1 8SOIC; Manufacturer: Texas Instruments; Supplier: Mouser; LCSC Part Number: C3235059; Manufacturer Part Number: THVD1449DR; RoHS: No; Item Type: IC; Stock: 7454; Pricing: 1=3.62, 10=2.51, 50=2.51, 100=2.27, 1000=2.02, 10000=1.95 (USD)